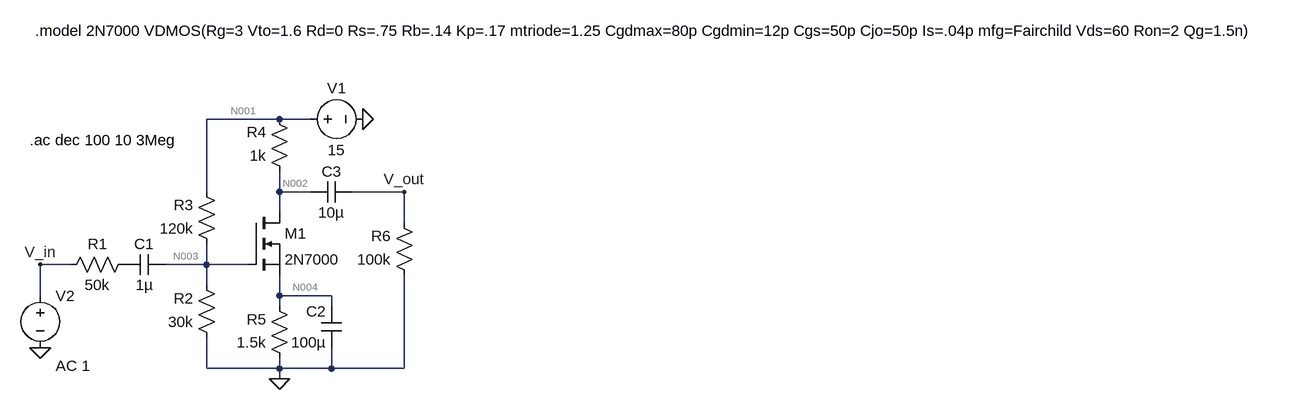
[diagram p0: schematic mosfetAMP.asc]
mosfetAMP.asc, the LTspice schematic file:
Version 4
SHEET 1 1948 680
WIRE 256 -32 144 -32
WIRE 304 -32 256 -32
WIRE 144 80 144 -32
WIRE 256 80 256 48
WIRE 304 80 256 80
WIRE 448 80 368 80
WIRE 256 112 256 80
WIRE 448 128 448 80
WIRE -64 192 -112 192
WIRE 144 192 144 160
WIRE 144 192 80 192
WIRE 208 192 144 192
WIRE 144 224 144 192
WIRE -112 240 -112 192
WIRE 256 240 256 208
WIRE 336 240 256 240
WIRE 256 256 256 240
WIRE 336 256 336 240
WIRE 144 352 144 304
WIRE 256 352 256 336
WIRE 256 352 144 352
WIRE 336 352 336 320
WIRE 336 352 256 352
WIRE 448 352 448 208
WIRE 448 352 336 352
WIRE 256 368 256 352
FLAG 256 368 0
FLAG 384 -32 0
FLAG -112 320 0
FLAG 448 80 V_out
FLAG -112 192 V_in
SYMBOL nmos 208 112 R0
SYMATTR InstName M1
SYMATTR Value 2N7000
SYMBOL res 32 176 R90
WINDOW 0 0 56 VBottom 2
WINDOW 3 32 56 VTop 2
SYMATTR InstName R1
SYMATTR Value 50k
SYMBOL res 160 320 R180
WINDOW 0 36 76 Left 2
WINDOW 3 36 40 Left 2
SYMATTR InstName R2
SYMATTR Value 30k
SYMBOL res 160 176 R180
WINDOW 0 36 76 Left 2
WINDOW 3 36 40 Left 2
SYMATTR InstName R3
SYMATTR Value 120k
SYMBOL res 272 64 R180
WINDOW 0 36 76 Left 2
WINDOW 3 36 40 Left 2
SYMATTR InstName R4
SYMATTR Value 1k
SYMBOL res 272 352 R180
WINDOW 0 36 76 Left 2
WINDOW 3 36 40 Left 2
SYMATTR InstName R5
SYMATTR Value 1.5k
SYMBOL res 464 224 R180
WINDOW 0 36 76 Left 2
WINDOW 3 36 40 Left 2
SYMATTR InstName R6
SYMATTR Value 100k
SYMBOL cap 80 176 R90
WINDOW 0 0 32 VBottom 2
WINDOW 3 32 32 VTop 2
SYMATTR InstName C1
SYMATTR Value 1µ
SYMBOL cap 352 320 R180
WINDOW 0 24 56 Left 2
WINDOW 3 24 8 Left 2
SYMATTR InstName C2
SYMATTR Value 100µ
SYMBOL cap 304 96 R270
WINDOW 0 32 32 VTop 2
WINDOW 3 0 32 VBottom 2
SYMATTR InstName C3
SYMATTR Value 10µ
SYMBOL voltage 288 -32 R270
WINDOW 0 32 56 VTop 2
WINDOW 3 -32 56 VBottom 2
SYMATTR InstName V1
SYMATTR Value 15
SYMBOL voltage -112 224 R0
WINDOW 123 24 124 Left 2
WINDOW 39 0 0 Left 0
SYMATTR InstName V2
SYMATTR Value ""
SYMATTR Value2 AC 1
TEXT -120 -168 Left 2 !.model 2N7000 VDMOS(Rg=3 Vto=1.6 Rd=0 Rs=.75 Rb=.14 Kp=.17 mtriode=1.25 Cgdmax=80p Cgdmin=12p Cgs=50p Cjo=50p Is=.04p mfg=Fairchild Vds=60 Ron=2 Qg=1.5n)
TEXT -128 0 Left 2 !.ac dec 100 10 3Meg

The netlist it stands for:
* mosfetAMP.asc
M1 N002 N003 N004 N004 2N7000
R1 P001 V_in 50k
R2 0 N003 30k
R3 N003 N001 120k
R4 N002 N001 1k
R5 0 N004 1.5k
R6 0 V_out 100k
C1 N003 P001 1µ
C2 0 N004 100µ
C3 N002 V_out 10µ
V1 N001 0 15
V2 V_in 0 AC 1
.model NMOS NMOS
.model PMOS PMOS
.lib standard.mos
.model 2N7000 VDMOS(Rg=3 Vto=1.6 Rd=0 Rs=.75 Rb=.14 Kp=.17 mtriode=1.25 Cgdmax=80p Cgdmin=12p Cgs=50p Cjo=50p Is=.04p mfg=Fairchild Vds=60 Ron=2 Qg=1.5n)
.ac dec 100 10 3Meg
.backanno
.end

* Results of the author's LTspice run, read from the files saved beside the schematic
* Operating Point, zero values left out:
*   V(n002) = 14.13 V
*   V(n003) = 3 V
*   V(n004) = 1.298 V
*   V(n001) = 15 V
*   Id(M1) = 865.6 µA
*   Ig(M1) = -14.37 pA
*   Is(M1) = -865.6 µA
*   I(R5) = -865.6 µA
*   I(R4) = -865.6 µA
*   I(R3) = -100 µA
*   I(R2) = -100 µA
*   I(V1) = -965.6 µA
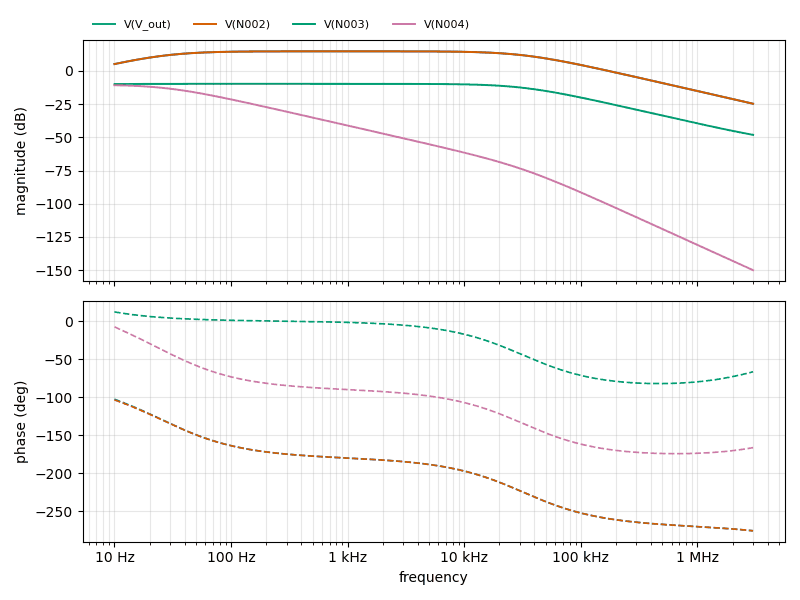
[diagram p1: AC Analysis of mosfetAMP.asc, plotted from the saved traces]
* AC Analysis, 1 run:
*   V(V_out): 5.09 dB at 10 Hz, -24.75 dB at 3 MHz, peak 14.71 dB at 955 Hz, 3 dB below the peak at 28.12 Hz and 32.09 kHz
*   V(N002): 5.09 dB at 10 Hz, -24.75 dB at 3 MHz, peak 14.71 dB at 955 Hz, 3 dB below the peak at 28.12 Hz and 32.09 kHz
*   V(N003): -9.98 dB at 10 Hz, -48.16 dB at 3 MHz, peak -9.77 dB at 275.4 Hz, 3 dB below the peak at 32.04 kHz
*   V(N004): -10.83 dB at 10 Hz, -150.00 dB at 3 MHz, peak -10.83 dB at 10 Hz, 3 dB below the peak at 32.56 Hz